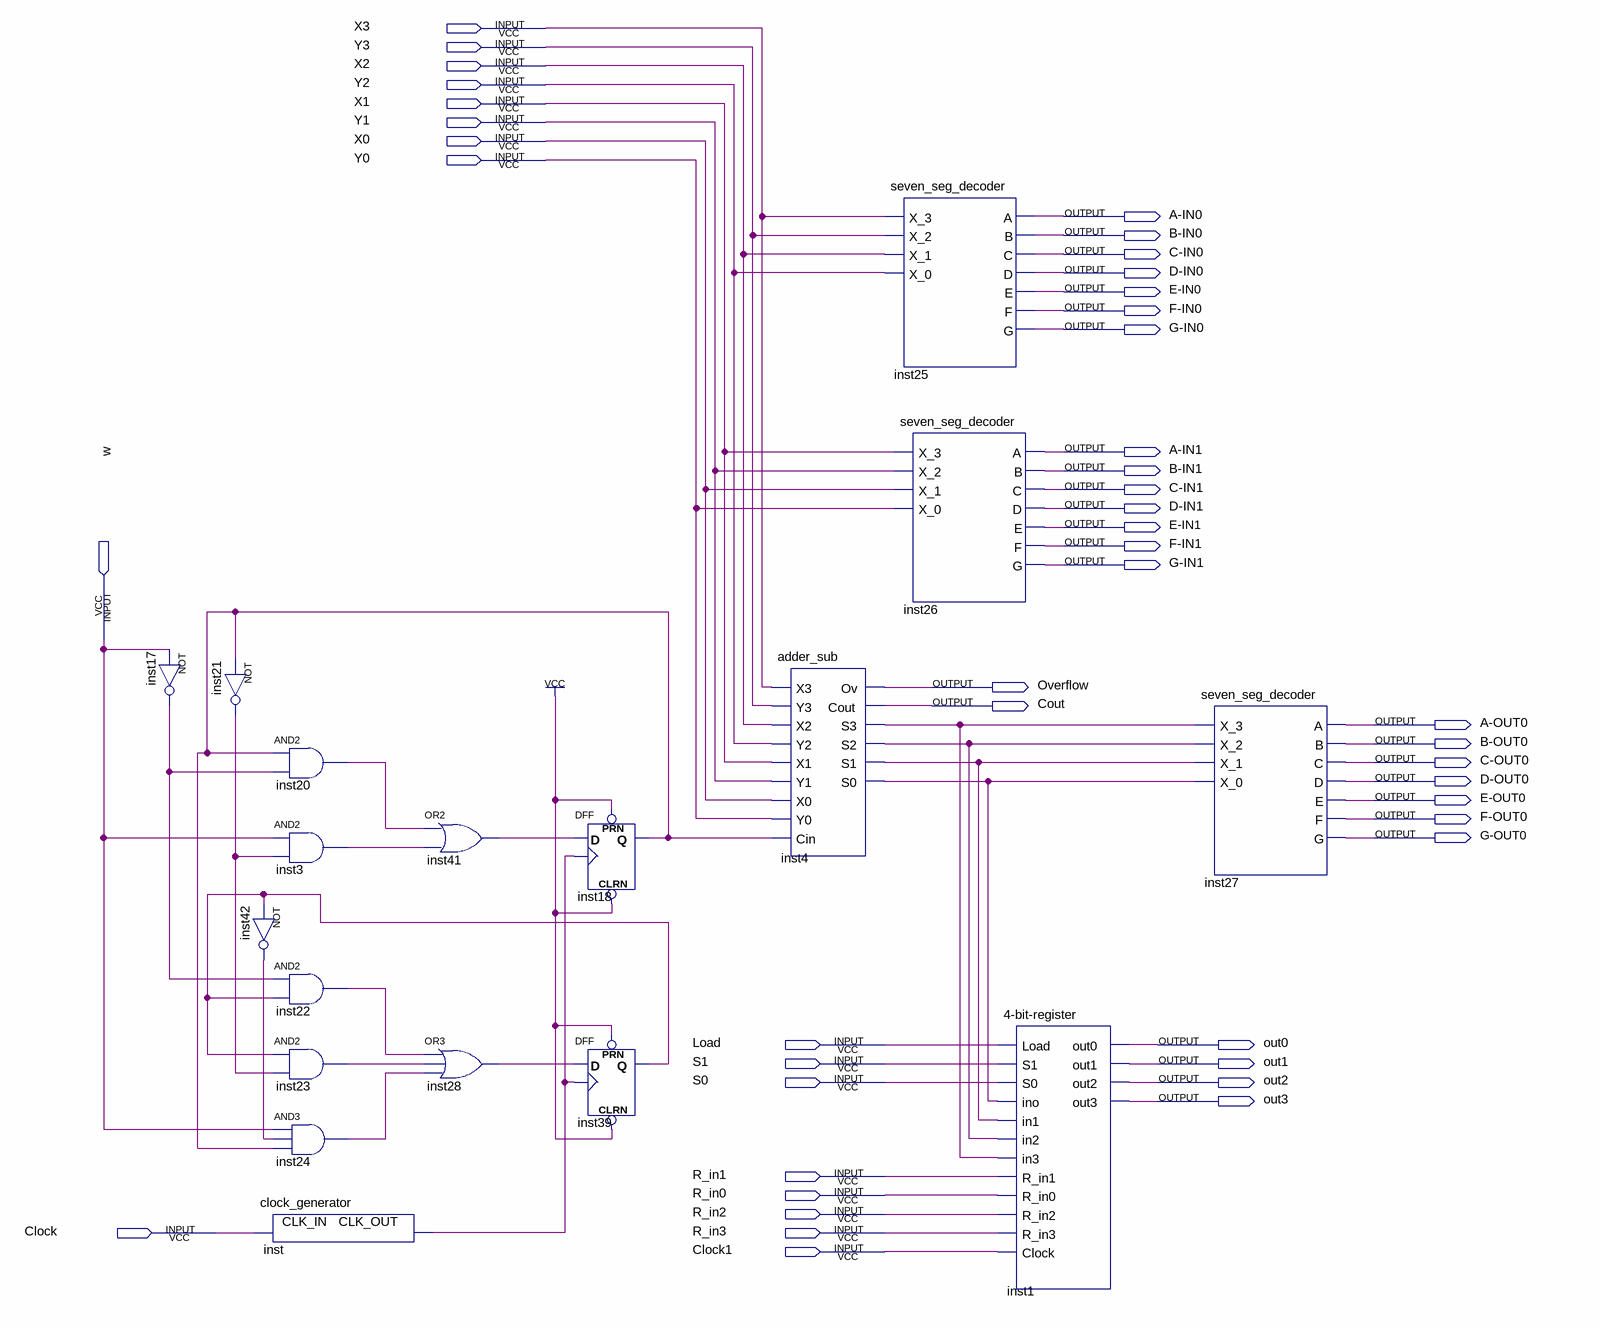
[diagram p0: schematic sheet]
// Quartus schematic calculator_decoder.bdf as structural Verilog: 18 symbols, 45 pins
module calculator_decoder (
  input  X3,
  input  Y3,
  input  X2,
  input  Y2,
  input  X1,
  input  Y1,
  input  X0,
  input  Y0,
  input  w,
  input  Load,
  input  S1,
  input  S0,
  input  R_in1,
  input  R_in0,
  input  R_in2,
  input  Clock,
  input  R_in3,
  input  Clock1,
  output \A-IN0 ,
  output \B-IN0 ,
  output \C-IN0 ,
  output \D-IN0 ,
  output \E-IN0 ,
  output \F-IN0 ,
  output \G-IN0 ,
  output \A-IN1 ,
  output \B-IN1 ,
  output \C-IN1 ,
  output \D-IN1 ,
  output \E-IN1 ,
  output \F-IN1 ,
  output \G-IN1 ,
  output Overflow,
  output Cout,
  output \A-OUT0 ,
  output \B-OUT0 ,
  output \C-OUT0 ,
  output \D-OUT0 ,
  output \E-OUT0 ,
  output \F-OUT0 ,
  output \G-OUT0 ,
  output out0,
  output out1,
  output out2,
  output out3
);

  wire inst3_out, inst4_s0, inst4_s1, inst4_s2, inst4_s3, inst17_out, inst18_q, inst20_out, inst21_out,
       inst22_out, inst23_out, inst24_out, inst28_out, inst39_q, inst41_out, inst42_out, inst_clk_out;

  not inst17 (inst17_out, w);
  not inst21 (inst21_out, inst18_q);
  not inst42 (inst42_out, inst39_q);
  clock_generator inst (.CLK_IN(Clock), .CLK_OUT(inst_clk_out));
  and inst20 (inst20_out, inst18_q, inst17_out);
  and inst3 (inst3_out, w, inst21_out);
  and inst22 (inst22_out, inst17_out, inst39_q);
  and inst23 (inst23_out, inst39_q, inst21_out);
  and inst24 (inst24_out, w, inst42_out, inst18_q);
  or inst41 (inst41_out, inst20_out, inst3_out);
  or inst28 (inst28_out, inst22_out, inst23_out, inst24_out);
  DFF inst18 (.CLRN(1'b1), .CLK(inst_clk_out), .D(inst41_out), .PRN(1'b1), .Q(inst18_q));
  DFF inst39 (.CLRN(1'b1), .CLK(inst_clk_out), .D(inst28_out), .PRN(1'b1), .Q(inst39_q));
  adder_sub inst4 (
    .X3(X3), .Y3(Y3), .X2(X2), .Y2(Y2), .X1(X1), .Y1(Y1), .X0(X0), .Y0(Y0), .Cin(inst18_q), .Ov(Overflow),
    .Cout(Cout), .S3(inst4_s3), .S2(inst4_s2), .S1(inst4_s1), .S0(inst4_s0));
  seven_seg_decoder inst25 (
    .X_3(X3), .X_2(Y3), .X_1(X2), .X_0(Y2), .A(\A-IN0 ), .B(\B-IN0 ), .C(\C-IN0 ), .D(\D-IN0 ), .E(\E-IN0 ),
    .F(\F-IN0 ), .G(\G-IN0 ));
  seven_seg_decoder inst26 (
    .X_3(X1), .X_2(Y1), .X_1(X0), .X_0(Y0), .A(\A-IN1 ), .B(\B-IN1 ), .C(\C-IN1 ), .D(\D-IN1 ), .E(\E-IN1 ),
    .F(\F-IN1 ), .G(\G-IN1 ));
  \4-bit-register  inst1 (
    .Load(Load), .S1(S1), .S0(S0), .ino(inst4_s0), .in1(inst4_s1), .in2(inst4_s2), .in3(inst4_s3),
    .R_in1(R_in1), .R_in0(R_in0), .R_in2(R_in2), .R_in3(R_in3), .Clock(Clock1), .out0(out0), .out1(out1),
    .out2(out2), .out3(out3));
  seven_seg_decoder inst27 (
    .X_3(inst4_s3), .X_2(inst4_s2), .X_1(inst4_s1), .X_0(inst4_s0), .A(\A-OUT0 ), .B(\B-OUT0 ), .C(\C-OUT0 ),
    .D(\D-OUT0 ), .E(\E-OUT0 ), .F(\F-OUT0 ), .G(\G-OUT0 ));
endmodule
